# Altium schematic sheet Battery Monitoring.SchDoc
size A; SheetNumber: 1; SheetTotal: 2
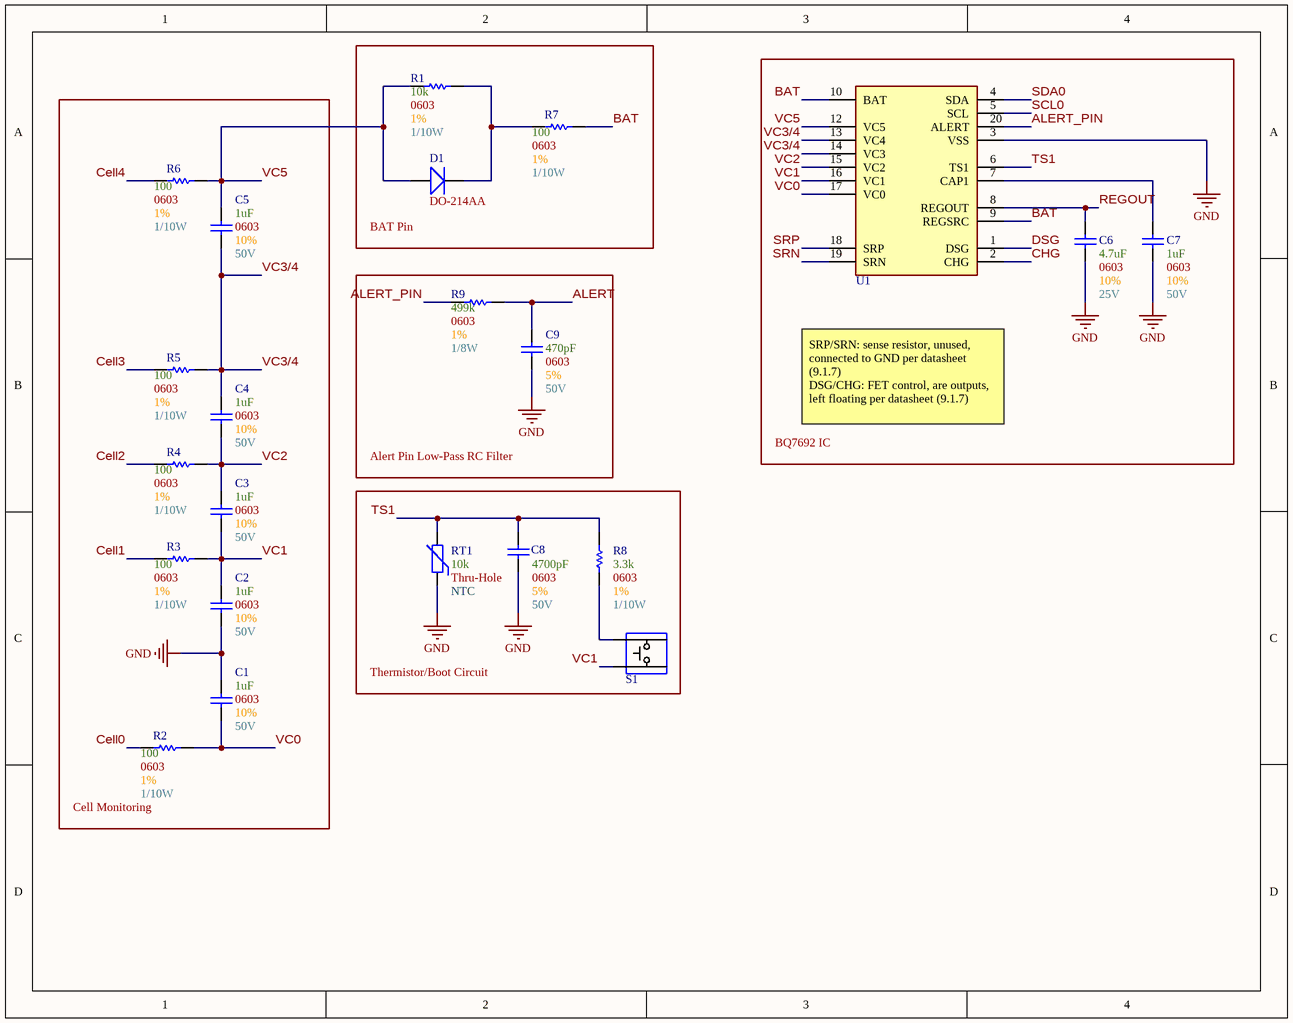
[diagram p0: Battery Monitoring.SchDoc]

## Parts
C1  Max Voltage: 50V  Size Package: 0603  Tolerance: 10%  Capacitance: 1uF  [[Cap] SMD 0603]  (hidden comment: [Cap] 0603 1uF 10% 50V)
C2  Max Voltage: 50V  Size Package: 0603  Tolerance: 10%  Capacitance: 1uF  [[Cap] SMD 0603]  (hidden comment: [Cap] 0603 1uF 10% 50V)
C3  Max Voltage: 50V  Size Package: 0603  Tolerance: 10%  Capacitance: 1uF  [[Cap] SMD 0603]  (hidden comment: [Cap] 0603 1uF 10% 50V)
C4  Max Voltage: 50V  Size Package: 0603  Tolerance: 10%  Capacitance: 1uF  [[Cap] SMD 0603]  (hidden comment: [Cap] 0603 1uF 10% 50V)
C5  Max Voltage: 50V  Size Package: 0603  Tolerance: 10%  Capacitance: 1uF  [[Cap] SMD 0603]  (hidden comment: [Cap] 0603 1uF 10% 50V)
C6  Max Voltage: 25V  Size Package: 0603  Tolerance: 10%  Capacitance: 4.7uF  [[Cap] SMD 0603]  (hidden comment: [Cap] 0603 4.7uF 10% 25V)
C7  Max Voltage: 50V  Size Package: 0603  Tolerance: 10%  Capacitance: 1uF  [[Cap] SMD 0603]  (hidden comment: [Cap] 0603 1uF 10% 50V)
C8  Max Voltage: 50V  Size Package: 0603  Tolerance: 5%  Capacitance: 4700pF  [[Cap] SMD 0603]  (hidden comment: [Cap] 0603 4700pF 5% 50V)
C9  Max Voltage: 50V  Size Package: 0603  Tolerance: 5%  Capacitance: 470pF  [[Cap] SMD 0603]  (hidden comment: [Cap] 0603 470pF 5% 50V)
D1  Package: DO-214AA  [[Diode] SMD DO-214AA]  (hidden comment: Rectifier)
R1  Wattage: 1/10W  Tolerance: 1%  Resistance: 10k  Size Package: 0603  [[Res] SMD 0603]  (hidden comment: [10k] SMD 0603 1% 1/8W)
R2  Wattage: 1/10W  Tolerance: 1%  Resistance: 100  Size Package: 0603  [[Res] SMD 0603]  (hidden comment: [100] SMD 0603 1% 1/10W)
R3  Wattage: 1/10W  Tolerance: 1%  Resistance: 100  Size Package: 0603  [[Res] SMD 0603]  (hidden comment: [100] SMD 0603 1% 1/10W)
R4  Wattage: 1/10W  Tolerance: 1%  Resistance: 100  Size Package: 0603  [[Res] SMD 0603]  (hidden comment: [100] SMD 0603 1% 1/10W)
R5  Wattage: 1/10W  Tolerance: 1%  Resistance: 100  Size Package: 0603  [[Res] SMD 0603]  (hidden comment: [100] SMD 0603 1% 1/10W)
R6  Wattage: 1/10W  Tolerance: 1%  Resistance: 100  Size Package: 0603  [[Res] SMD 0603]  (hidden comment: [100] SMD 0603 1% 1/10W)
R7  Wattage: 1/10W  Tolerance: 1%  Resistance: 100  Size Package: 0603  [[Res] SMD 0603]  (hidden comment: [100] SMD 0603 1% 1/10W)
R8  Wattage: 1/10W  Tolerance: 1%  Resistance: 3.3k  Size Package: 0603  [[Res] SMD 0603]  (hidden comment: [3.3k] SMD 0603 1% 1/10W)
R9  Wattage: 1/8W  Tolerance: 1%  Resistance: 499k  Size Package: 0603  [[Res] SMD 0603]  (hidden comment: [499k] SMD 0603 1% 1/8W)
RT1  Size Package: Thru-Hole  Max Resistance: 10k  Thermistor Type: NTC  [[NTC] 10k Thru-Hole]  (hidden comment: [NTC] 10k Thru-Hole)
S1  Standard pushbutton  [[SPST] Pushbutton]  (value not drawn)
U1  [Batt Mon] 3-5 Cell BMS  [[Batt Mon] 3-5 Cell BMS]  (value not drawn)

## Blocks framed on the sheet
BAT Pin: D1 R1 R7
BQ7692 IC: C6 C7 U1
Cell Monitoring: C1-C5 R2-R6
Alert Pin Low-Pass RC Filter: C9 R9
Thermistor/Boot Circuit: C8 R8 RT1 S1

## Nets
GND: C1.2 C2.1 C6.1 C7.1 C8.1 C9.1 RT1.1 U1.3(VSS)
ALERT: C9.2 R9.2
ALERT_PIN: R9.1 U1.20(ALERT)
BAT: R7.2 U1.9(REGSRC) U1.10(BAT)
Cell0: R2.1
Cell1: R3.1
Cell2: R4.1
Cell3: R5.1
Cell4: R6.1
CHG: U1.2(CHG)
DSG: U1.1(DSG)
REGOUT: C6.2 U1.8(REGOUT)
SCL0: U1.5(SCL)
SDA0: U1.4(SDA)
SRN: U1.19(SRN)
SRP: U1.18(SRP)
TS1: C8.2 R8.2 RT1.2 U1.6(TS1)
VC0: C1.1 R2.2 U1.17(VC0)
VC1: C2.2 C3.1 R3.2 S1.2 U1.16(VC1)
VC2: C3.2 C4.1 R4.2 U1.15(VC2)
VC3/4: C4.2 C5.1 R5.2 U1.13(VC4) U1.14(VC3)
VC5: C5.2 D1.2(Anode) R1.2 R6.2 U1.12(VC5)
NetC7_2: C7.2 U1.7(CAP1)
NetD1_1: D1.1(Cathode) R1.1 R7.1
NetR8_1: R8.1 S1.1

## Notes on the sheet
- SRP/SRN: sense resistor, unused, connected to GND per datasheet (9.1.7)
  DSG/CHG: FET control, are outputs, left floating per datasheet (9.1.7)

## Library data of the parts
C1-C5 C7 = [Cap] 0603 1uF 10% 50V: UMK107AB7105KA-T; Supplier 1: DigiKey; Supplier Part Number 1: 587-3247-1-ND
C6 = [Cap] 0603 4.7uF 10% 25V: GRM188R61E475KE11D; Supplier 1: DigiKey; Supplier Part Number 1: 490-7203-6-ND
C8 = [Cap] 0603 4700pF 5% 50V: GRM1885C1H472JA01D; Supplier 1: DigiKey; Supplier Part Number 1: 490-9669-6-ND
C9 = [Cap] 0603 470pF 5% 50V: C0603C471J5GACTU; Supplier 1: DigiKey; Supplier Part Number 1: 399-C0603C471J5GACTUDKR-ND
D1 = [Rectifier] SMD 1000V 1A: S1MB-13-F; Supplier 1: DigiKey; Supplier Part Number 1: S1MB-FDICT-ND
R1 = [10k] SMD 0603 1% 1/8W: RMCF0603FT10K0; Supplier 1: DigiKey; Supplier Part Number 1: RMCF0603FT10K0DKR-ND
R2-R7 = [100] SMD 0603 1% 1/10W: RC0603FR-07100RL; Supplier 1: DigiKey; Supplier Part Number 1: 311-100HRDKR-ND
R8 = [3.3k] SMD 0603 1% 1/10W: RC0603FR-073K3L; Supplier 1: DigiKey; Supplier Part Number 1: 311-3.30KHRCT-ND
R9 = [499k] SMD 0603 1% 1/8W: CRCW0603499KFKEA; Supplier 1: DigiKey; Supplier Part Number 1: 541-499KHCT-ND
RT1 = [NTC] 10k Thru-Hole: B57164K0103J000; Supplier 1: DigiKey; Supplier Part Number 1: 495-2080-ND
S1 = [SPST] Pushbutton: Supplier 1: DigiKey; Supplier Part Number 1: 450-1650-ND
U1 = [Batt Mon] 3-5 Cell BMS: BQ7692006PWR; Supplier 1: DigiKey; Supplier Part Number 1: 296-39960-1-ND